# Altium schematic sheet Sheet1.SchDoc
size A; SheetNumber: 1; SheetTotal: 1
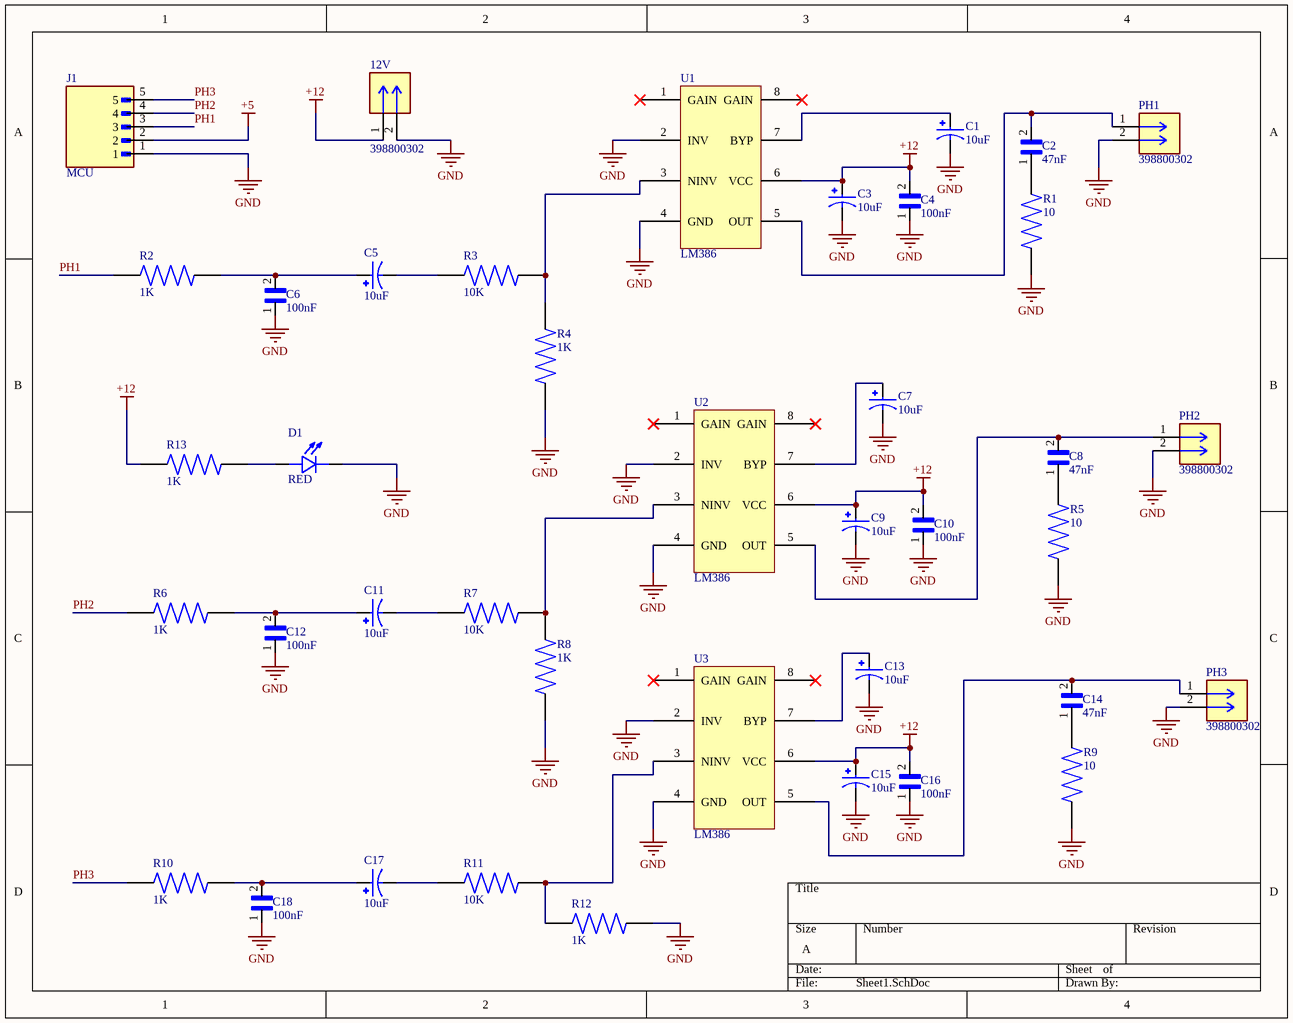
[diagram p0: Sheet1.SchDoc]

## Parts
12V  398800302  [CONN_398800302_MOL]
C1  10uF  [CAPPRD250W50D630H1120]
C2  47nF  [CAPRR508W50L508T318H762]
C3  10uF  [CAPPRD250W50D630H1120]
C4  100nF  [CAPRR508W50L508T318H762]
C5  10uF  [CAPPRD250W50D630H1120]
C6  100nF  [CAPRR508W50L508T318H762]
C7  10uF  [CAPPRD250W50D630H1120]
C8  47nF  [CAPRR508W50L508T318H762]
C9  10uF  [CAPPRD250W50D630H1120]
C10  100nF  [CAPRR508W50L508T318H762]
C11  10uF  [CAPPRD250W50D630H1120]
C12  100nF  [CAPRR508W50L508T318H762]
C13  10uF  [CAPPRD250W50D630H1120]
C14  47nF  [CAPRR508W50L508T318H762]
C15  10uF  [CAPPRD250W50D630H1120]
C16  100nF  [CAPRR508W50L508T318H762]
C17  10uF  [CAPPRD250W50D630H1120]
C18  100nF  [CAPRR508W50L508T318H762]
D1  RED  [LEDRD254W51D580H870]
J1  MCU  [HARWIN_M20-9990546]
PH1  398800302  [CONN_398800302_MOL]
PH2  398800302  [CONN_398800302_MOL]
PH3  398800302  [CONN_398800302_MOL]
R1  10  [RESAD700W45L350D185]
R2  1K  [RESAD700W45L350D185]
R3  10K  [RESAD700W45L350D185]
R4  1K  [RESAD700W45L350D185]
R5  10  [RESAD700W45L350D185]
R6  1K  [RESAD700W45L350D185]
R7  10K  [RESAD700W45L350D185]
R8  1K  [RESAD700W45L350D185]
R9  10  [RESAD700W45L350D185]
R10  1K  [RESAD700W45L350D185]
R11  10K  [RESAD700W45L350D185]
R12  1K  [RESAD700W45L350D185]
R13  1K  [RESAD700W45L350D185]
U1  LM386  [PCBComponent_1]
U2  LM386  [PCBComponent_1]
U3  LM386  [PCBComponent_1]

## Nets
+5: J1.2
+12: 12V.1 C3.P C4.2 C9.P C10.2 C15.P C16.2 R13.1 U1.6(VCC) U2.6(VCC) U3.6(VCC)
GND: 12V.2 C1.N C3.N C4.1 C6.1 C7.N C9.N C10.1 C12.1 C13.N C15.N C16.1 C18.1 D1.2(C) J1.1 PH1.2 PH2.2 PH3.2 R1.1 R4.1 R5.1 R8.1 R9.1 R12.1 U1.2(INV) U1.4(GND) U2.2(INV) U2.4(GND) U3.2(INV) U3.4(GND)
PH1: J1.3 R2.1
PH2: J1.4 R6.1
PH3: J1.5 R10.1
NetC1_P: C1.P U1.7(BYP)
NetC2_1: C2.1 R1.2
NetC2_2: C2.2 PH1.1 U1.5(OUT)
NetC5_N: C5.N R3.1
NetC5_P: C5.P C6.2 R2.2
NetC7_P: C7.P U2.7(BYP)
NetC8_1: C8.1 R5.2
NetC8_2: C8.2 PH2.1 U2.5(OUT)
NetC11_N: C11.N R7.1
NetC11_P: C11.P C12.2 R6.2
NetC13_P: C13.P U3.7(BYP)
NetC14_1: C14.1 R9.2
NetC14_2: C14.2 PH3.1 U3.5(OUT)
NetC17_N: C17.N R11.1
NetC17_P: C17.P C18.2 R10.2
NetD1_1: D1.1(A) R13.2
NetR3_2: R3.2 R4.2 U1.3(NINV)
NetR7_2: R7.2 R8.2 U2.3(NINV)
NetR11_2: R11.2 R12.2 U3.3(NINV)

Not connected (* = marked no-connect by the designer): U1 1(GAIN)* 8(GAIN)*; U2 1(GAIN)* 8(GAIN)*; U3 1(GAIN)* 8(GAIN)*

## Library data of the parts
12V PH1-PH3 = 398800302: 2 Position Wire to Board Terminal Block Horizontal with Board 0.200 (5.08mm) Through Hole; MF: Molex; MP: 0398800302; SnapEDA_Link: https://www.snapeda.com/parts/0398800302/Molex/view-part/?ref=snap; Package: None; Value: *; Check_prices: https://www.snapeda.com/parts/0398800302/Molex/view-part/?ref=eda
C1 C3 C5 C7 C9 C11 C13 C15 C17 = EEUHD1E101: Ø®Ø§Ø²Ù† Ù‡Ø§ÛŒ Ø§Ù„Ú©ØªØ±ÙˆÙ„ÛŒØªÛŒ Ø¢Ù„ÙˆÙ…ÛŒÙ†ÛŒÙˆÙ…ÛŒ 100F 25V Ø´Ø¹Ø§Ø¹ÛŒØŒ Ù‚ÙˆØ·ÛŒ 1000 Ø³Ø§Ø¹Øª @ 105C; MP: EEU-HD1E101; MF: Panasonic; Purchase-URL: https://pricing.snapeda.com/search/part/EEU-HD1E101/?ref=eda; Value: *; SnapEDA_Link: https://www.snapeda.com/parts/EEU-HD1E101/Panasonic/view-part/?ref=snap; Price: None; Package: RADIAL-2 Panasonic; Check_prices: https://www.snapeda.com/parts/EEU-HD1E101/Panasonic/view-part/?ref=eda; Availability: In Stock
C2 C4 C6 C8 C10 C12 C14 C16 C18 = AR215C104K4R: AR 100nF Ceramic Multilayer Cap,50V dc,+125C,X7R Dielectric,+/-10%,Through Hole | AVX AR215C104K4R; SnapEDA_Link: https://www.snapeda.com/parts/AR215C104K4R/AVX/view-part/?ref=snap; Package: Radial AVX; Value: *; MF: AVX; MP: AR215C104K4R; Check_prices: https://www.snapeda.com/parts/AR215C104K4R/AVX/view-part/?ref=eda
D1 = OVLFR3C7: Red 5 mm 30Â° Clear 5000 mcd 2.2 V Round LED Lamp Through Hole; MF: Optek; SnapEDA_Link: https://www.snapeda.com/parts/OVLFR3C7/Optek/view-part/?ref=snap; Package: Radial Optek; Value: *; MP: OVLFR3C7; Check_prices: https://www.snapeda.com/parts/OVLFR3C7/Optek/view-part/?ref=eda
J1 = M20-9990546: MF: Harwin; Package: None; Price: None; Value: *; MP: M20-9990546; Availability: Unavailable
R1-R13 = 2-1623927-3: Carbon Film Resistors - Through Hole 1K Ohm 5% 1/4W Res Carbon Film; Power_Rating: .25 W; MF: TE Connectivity; Voltage_Rating: 200 V; SnapEDA_Link: https://www.snapeda.com/parts/2-1623927-3/TE+Connectivity/view-part/?ref=snap; Package: None; Resistance: 1K; Value: *; MP: 2-1623927-3; EU_RoHS_Compliance: Compliant; Tolerance: 5%; Check_prices: https://www.snapeda.com/parts/2-1623927-3/TE+Connectivity/view-part/?ref=eda
U1-U3 = DIP-8 Socket